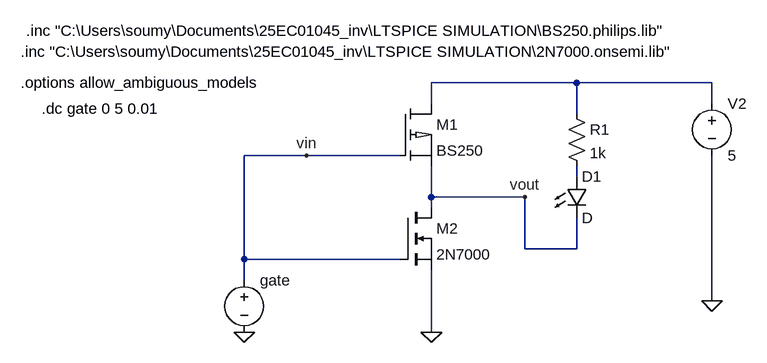
[diagram p0: schematic extra_question_part_2.asc]
extra_question_part_2.asc, the LTspice schematic file:
Version 4.1
SHEET 1 880 680
WIRE 304 16 80 16
WIRE 512 16 304 16
WIRE 80 48 80 16
WIRE 512 48 512 16
WIRE 304 64 304 16
WIRE -112 128 -208 128
WIRE 32 128 -112 128
WIRE 304 160 304 144
WIRE 80 192 80 144
WIRE 224 192 80 192
WIRE 80 208 80 192
WIRE 224 272 224 192
WIRE 304 272 304 224
WIRE 304 272 224 272
WIRE -208 288 -208 128
WIRE 32 288 -208 288
WIRE -208 320 -208 288
WIRE 512 352 512 128
WIRE 80 400 80 304
FLAG -208 400 0
FLAG 512 352 0
FLAG 80 400 0
FLAG -112 128 vin
FLAG 224 192 vout
SYMBOL pmos 32 48 R0
SYMATTR InstName M1
SYMATTR Value BS250
SYMATTR Prefix X
SYMBOL nmos 32 208 R0
SYMATTR InstName M2
SYMATTR Value 2N7000
SYMATTR Prefix X
SYMBOL voltage -208 304 R0
WINDOW 123 0 0 Left 0
WINDOW 39 0 0 Left 0
SYMATTR InstName gate
SYMATTR Value ""
SYMBOL voltage 512 32 R0
WINDOW 123 0 0 Left 0
WINDOW 39 0 0 Left 0
SYMATTR InstName V2
SYMATTR Value 5
SYMBOL LED 288 160 R0
SYMATTR InstName D1
SYMBOL res 288 48 R0
SYMATTR InstName R1
SYMATTR Value 1k
TEXT -544 -64 Left 2 !.inc "C:\\Users\\soumy\\Documents\\25EC01045_inv\\LTSPICE SIMULATION\\BS250.philips.lib"
TEXT -552 -32 Left 2 !.inc "C:\\Users\\soumy\\Documents\\25EC01045_inv\\LTSPICE SIMULATION\\2N7000.onsemi.lib"
TEXT -552 16 Left 2 !.options allow_ambiguous_models
TEXT -520 56 Left 2 !.dc gate 0 5 0.01

The netlist it stands for:
* extra_question_part_2.asc
X§M1 vout vin N001 BS250  ; pins D G S
X§M2 vout vin 0 2N7000  ; pins D G S
V§gate vin 0
V2 N001 0 5
D1 N002 vout D
R1 N001 N002 1k
.model D D
.lib standard.dio
.inc "C:\Users\soumy\Documents\25EC01045_inv\LTSPICE SIMULATION\BS250.philips.lib"
.inc "C:\Users\soumy\Documents\25EC01045_inv\LTSPICE SIMULATION\2N7000.onsemi.lib"
.options allow_ambiguous_models
.dc gate 0 5 0.01
.backanno
.end

* Results of the author's LTspice run, read from the files saved beside the schematic
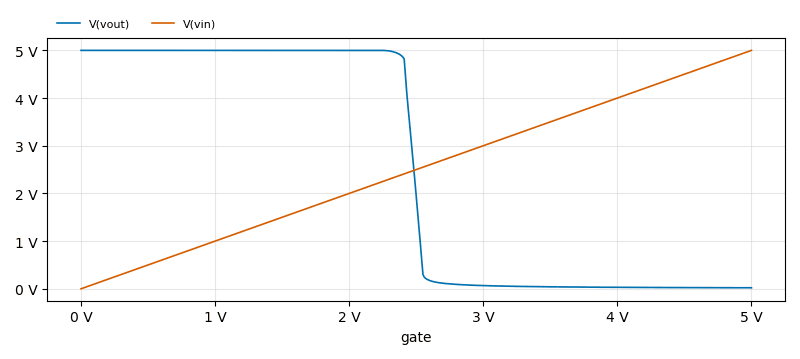
[diagram p1: DC transfer characteristic of extra_question_part_2.asc, plotted from the saved traces]
* DC transfer characteristic, 1 run:
*   V(vout): 5 V at gate=0 V, 21.45 mV at gate=5 V, min 21.45 mV, max 5 V
*   V(vin): 0 V at gate=0 V, 5 V at gate=5 V, min 0 V, max 5 V